# EasyEDA Pro project RUSH perseguidor - entalhe A.epro

# Board PCB1
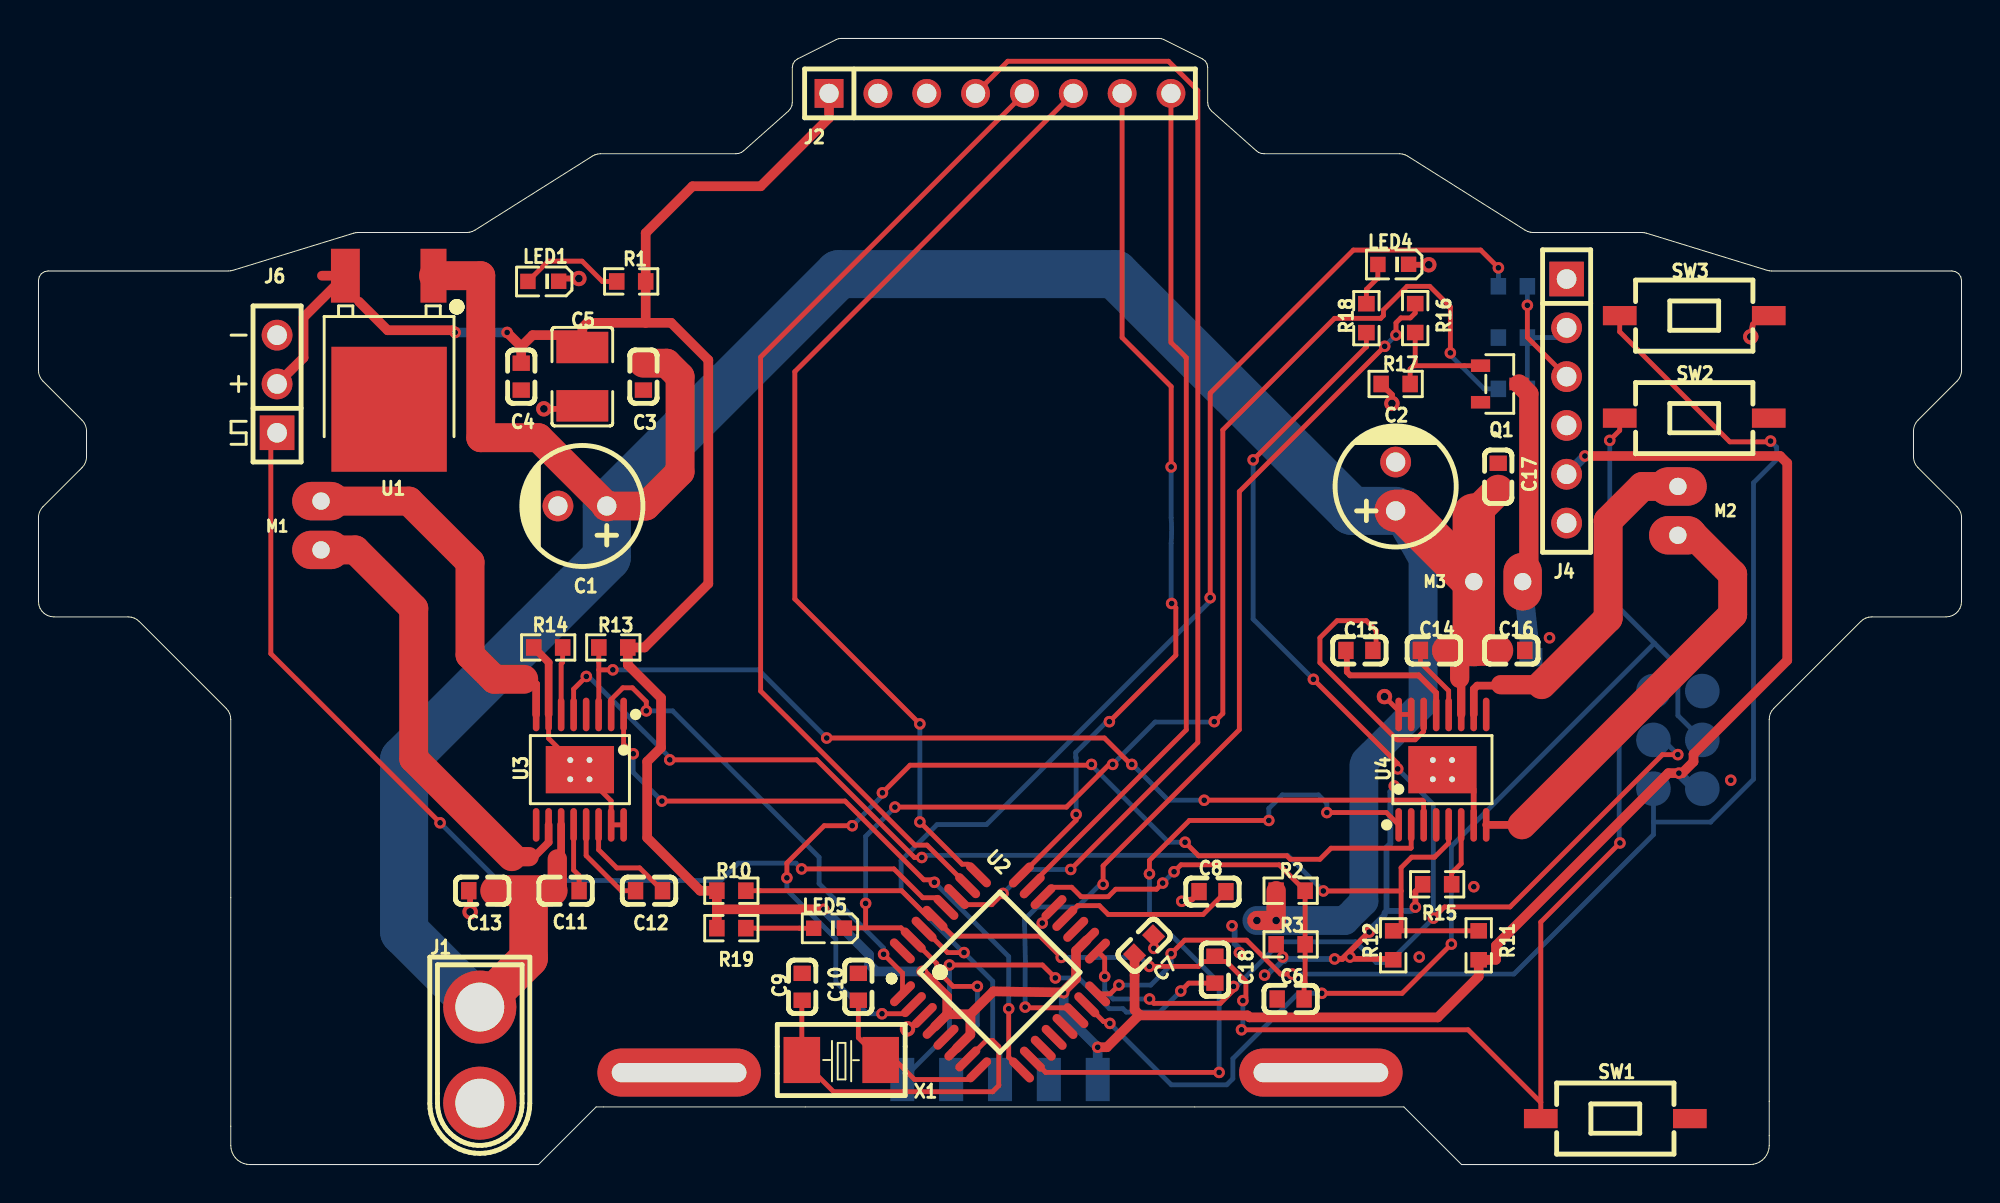
[diagram p0: board, top side]
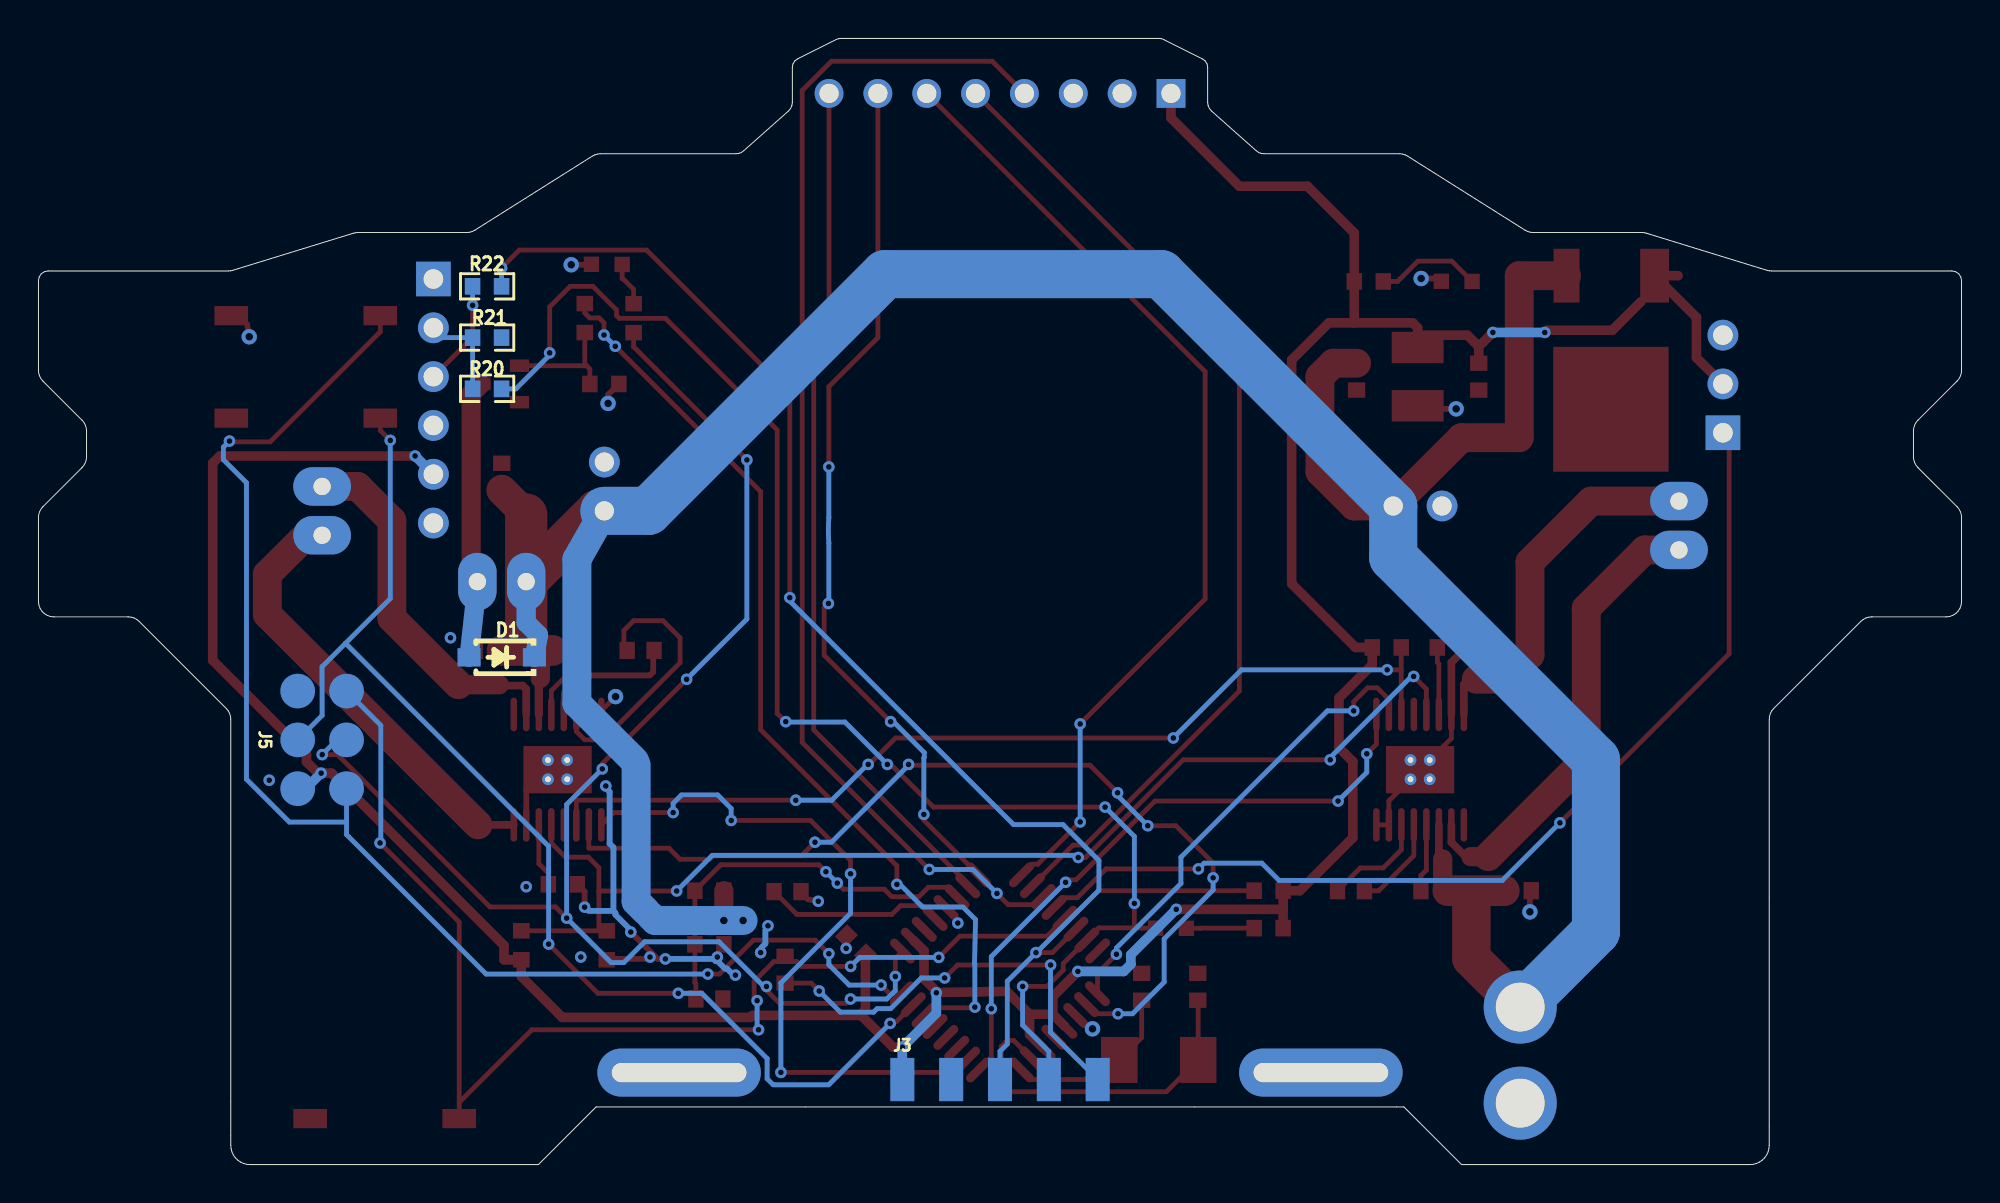
[diagram p1: board, bottom side, seen from below]

Outline 100 x 58.6 mm; copper layers: Top Layer, Bottom Layer. Coordinates in mm from the lower left corner of the outline.
Outline path: 0,46 0,41.33 arc(0.06,41.03) 0.23,40.77 2.27,38.73 arc(2.44,38.47) 2.5,38.17 2.5,36.83 arc(2.44,36.53) 2.27,36.27 0.23,34.23 arc(0.06,33.97) 0,33.67 0,29.3 0.02,29.12 0.08,28.95 0.17,28.8 0.3,28.67 0.45,28.58 0.62,28.52 0.8,28.5 4.67,28.5 4.83,28.48 4.97,28.44 5.11,28.36 5.23,28.27 9.77,23.73 9.86,23.61 9.94,23.47 9.98,23.33 10,23.17 10,1 10.02,0.83 10.06,0.66 10.13,0.5 10.23,0.36 10.36,0.23 10.5,0.13 10.66,0.06 10.83,0.01 11,0 26,0 29,3 71,3 74,0 89,0 89.17,0.01 89.34,0.06 89.5,0.13 89.64,0.23 89.77,0.36 89.87,0.5 89.94,0.66 89.99,0.83 90,1 90,23.17 90.01,23.33 90.06,23.47 90.13,23.61 90.23,23.73 94.77,28.27 94.89,28.36 95.03,28.44 95.18,28.48 95.33,28.5 99.2,28.5 99.38,28.52 99.55,28.58 99.7,28.67 99.82,28.8 99.92,28.95 99.98,29.12 100,29.3 100,33.67 arc(99.94,33.97) 99.77,34.23 97.73,36.27 arc(97.56,36.53) 97.5,36.83 97.5,38.17 arc(97.56,38.47) 97.73,38.73 99.77,40.77 arc(99.94,41.03) 100,41.33 100,46 99.96,46.19 99.85,46.35 99.69,46.46 99.5,46.5 90.12,46.5 90,46.51 89.88,46.53 83.62,48.47 83.5,48.49 83.38,48.5 77.73,48.5 77.58,48.51 77.44,48.56 77.3,48.62 71.2,52.48 71.06,52.54 70.92,52.59 70.77,52.6 63.73,52.6 63.58,52.62 63.45,52.67 63.33,52.75 61,54.82 60.89,54.95 60.82,55.1 60.8,55.27 60.8,57.09 60.77,57.27 60.67,57.43 60.52,57.54 58.51,58.55 58.4,58.59 58.28,58.6 41.72,58.6 41.6,58.59 41.49,58.55 39.48,57.54 39.33,57.43 39.23,57.27 39.2,57.09 39.2,55.27 39.18,55.1 39.11,54.95 39,54.82 36.67,52.75 36.55,52.67 36.42,52.62 36.27,52.6 29.23,52.6 29.08,52.59 28.94,52.54 28.8,52.48 22.7,48.62 22.56,48.56 22.42,48.51 22.27,48.5 16.62,48.5 16.5,48.49 16.39,48.47 10.11,46.53 10,46.51 9.88,46.5 0.5,46.5 0.31,46.46 0.15,46.35 0.04,46.19 0,46
Stack: Top Layer 0.035mm / Dielectric1 1.51mm FR4 er 4.5 / Bottom Layer 0.035mm

## Design rules (mm)
spacing copperThickness1oz (default): track to track 0.2, other pairs 0.2 to 0.3
spacing copperThickness2oz: track to track 0.203, other pairs 0.152 to 0.3
spacing Plane_innerPlane: track to track 0.2, other pairs 0.2 to 0.3
spacing Copper_copperRegion: track to track 0.2, other pairs 0.2 to 0.3
track width copperThickness1oz (default): min 0.25, default 0.25, max 3
track width copperThickness2oz: min 0.203, default 0.254, max 2.54
differential pair differentialPair (default): width min 0.127, default 0.254, max 2.54; gap min 0.152, default 0.152
net GND uses Copper_copperRegion, Plane_innerPlane
pour e1420 uses Copper_copperRegion
pour e1482 uses Copper_copperRegion

## Placement (name value [footprint] x y rotation side)
C1  220uF  [CAP-TH_BD6.3-P2.50-D1.0-FD]  28.28 34.27 180 top
C2  220uF  [CAP-TH_BD6.3-P2.50-D1.0-FD]  70.57 35.29 90 top
C3  220nF  [C0603]  31.46 41 270 top
C4  100nF  [C0603]  25.11 41 270 top
C5  47uF  [C1210]  28.28 41 90 top
C6  100nF  [C0603]  65.11 8.62 180 top
C7  100nF  [C0603]  57.49 11.41 45 top
C8  100nF  [C0603]  61.05 14.2 180 top
C9  22pF  [C0603]  39.71 9.25 90 top
C10  22pF  [C0603]  42.63 9.25 90 top
C11  100nF  [C0603]  27.41 14.25 0 top
C12  22nF  [C0603]  31.75 14.25 0 top
C13  100nF  [C0603]  23.08 14.25 180 top
C14  100nF  [C0603]  72.56 26.75 180 top
C15  22nF  [C0603]  68.69 26.75 0 top
C16  100nF  [C0603]  76.59 26.75 0 top
C17  100nF  [C0603]  75.91 35.79 90 top
C18  100nF  [C0603]  61.18 10.14 90 top
D1  1N5819  [SOD-123_L2.7-W1.6-LS3.7-RD-1]  75.91 26.4 0 bottom
J1  XT30 (bateria 2S)  [CONN-TH_XT30U-M]  22.95 5.69 270 top
J2  BARRA (1x8, 2,54 mm)  [HDR-TH_8P-P2.54-V-M]  50 55.74 0 top
J3  -  [seguidor_alpha:HDR_1x05_P2.54_SMD_DEITADA]  50 4.43 0 bottom
J4  -  [HDR-TH_6P-P2.54-V-F]  79.46 39.73 270 top
J5  -  [seguidor_alpha:ICSP_6P_SMD_BOT]  85.25 22.1 0 bottom
J6  -  [HDR-TH_3P-P2.54-V-F_KY022]  12.41 40.62 90 top
LED1  verde  [LED0603-RD_GREEN]  26.25 45.96 180 top
LED4  LED C  [LED0603-RD_GREEN]  70.45 46.84 180 top
LED5  TX  [LED0603-RD_GREEN]  41.11 12.3 180 top
M1  1020 esq.  [seguidor_alpha:MOTOR_1020_2P]  14.69 33.25 0 top
M2  1020 dir.  [seguidor_alpha:MOTOR_1020_2P]  85.25 34.02 180 top
M3  ventoinha  [seguidor_alpha:MOTOR_1020_2P]  75.91 30.33 270 top
NOREF  -  [Pad_e557]  66.69 4.79 270 top
NOREF#2  -  [Pad_e558]  33.31 4.79 270 top
Q1  AO3400A  [SOT-23-3_L2.9-W1.3-P1.90-LS2.4-BR]  75.99 40.62 180 top
R1  1k  [R0603]  30.82 45.95 180 top
R2  -  [R0603]  65.11 14.25 0 top
R3  -  [R0603]  65.11 11.46 180 top
R10  10k  [R0603]  36.03 14.25 0 top
R11  15k 1%  [R0603]  74.89 11.41 90 top
R12  10k 1%  [R0603]  70.45 11.41 270 top
R13  10k  [R0603]  29.89 26.91 180 top
R14  1.5k 1%  [R0603]  26.5 26.91 180 top
R15  1.5k 1%  [R0603]  72.73 14.58 180 top
R16  200  [R0603]  71.59 44.05 270 top
R17  10k  [R0603]  70.57 40.62 180 top
R18  1k  [R0603]  69.05 44.04 90 top
R19  1k  [R0603]  36.03 12.3 0 top
R20  1k  [R0603]  76.67 40.37 0 bottom
R21  2k  [R0603]  76.67 43.03 180 bottom
R22  4.7k  [R0603]  76.67 45.7 0 bottom
SW1  RESET  [KEY-SMD_L6.1-W3.7-LS8.0-2]  82 2.39 180 top
SW2  BOTÃO 1  [KEY-SMD_L6.1-W3.7-LS8.0-2]  86.1 38.84 0 top
SW3  BOTÃO 2  [KEY-SMD_L6.1-W3.7-LS8.0-2]  86.1 44.18 0 top
U1  78M05  [TO-252-2_L6.5-W6.1-P4.58-LS10.0-TL]  18.25 42.78 270 top
U2  ATmega328P-AU  [TQFP-32_L7.0-W7.0-P0.80-LS9.0-BL]  50 10 315 top
U3  DRV8874PWPR  [HTSSOP-16_L5.0-W4.4-P0.65-LS6.4-BL-EP]  28.15 20.55 180 top
U4  DRV8874PWPR  [HTSSOP-16_L5.0-W4.4-P0.65-LS6.4-BL-EP]  73.01 20.55 0 top
X1  16MHz  [CRYSTAL-SMD_L5.0-W3.2]  41.75 5.44 0 top

## Footprints (pads in the part's own frame, mm; a bottom-side part is the same pattern mirrored in y, then rotated)
C0603
  rect 0.8x0.9 smd: 1(-0.7,0) 2(0.7,0)
C1210
  rect 1.635x2.7 smd: 1(-1.518,0) 2(1.518,0)
CAP-TH_BD6.3-P2.50-D1.0-FD
  round 1.6 hole 1: 1(-1.27,0) 2(1.27,0)
CONN-TH_XT30U-M
  round 3.8 hole 2.54: 1(-2.5,0) 2(2.5,0)
CRYSTAL-SMD_L5.0-W3.2
  rect 1.9x2.4 smd: 1(-2.05,0) 2(2.05,0)
HDR-TH_3P-P2.54-V-F_KY022
  rect 1.8x1.8 hole 1.02: 1(-2.54,0)
  round 1.6 hole 1.02: 2(0,0) 3(2.54,0)
HDR-TH_6P-P2.54-V-F
  rect 1.8x1.8 hole 1.02: 1(-6.35,0)
  round 1.6 hole 1.02: 2(-3.81,0) 3(-1.27,0) 4(1.27,0) 5(3.81,0) 6(6.35,0)
HDR-TH_8P-P2.54-V-M
  rect 1.5x1.5 hole 1: 1(-8.89,0)
  round 1.5 hole 1: 2(-6.35,0) 3(-3.81,0) 4(-1.27,0) 5(1.27,0) 6(3.81,0) 7(6.35,0) 8(8.89,0)
HTSSOP-16_L5.0-W4.4-P0.65-LS6.4-BL-EP
  oval 0.343x1.746 smd: 1(-2.275,-2.873) 2(-1.625,-2.873) 3(-0.975,-2.873) 4(-0.325,-2.873) 5(0.325,-2.873) 6(0.975,-2.873) 7(1.625,-2.873) 8(2.275,-2.873) 9(2.275,2.873) 10(1.625,2.873) 11(0.975,2.873) 12(0.325,2.873) 13(-0.325,2.873) 14(-0.975,2.873) 15(-1.625,2.873) 16(-2.275,2.873)
  round 0.61 hole 0.305: 17(-0.5,0.5) 17(-0.5,-0.5) 17(0.5,0.5) 17(0.5,-0.5)
  rect 3.55x2.46 smd: 17(0,0)
KEY-SMD_L6.1-W3.7-LS8.0-2
  rect 1.75x1 smd: 1(-3.875,0) 2(3.875,0)
LED0603-RD_GREEN
  rect 0.8x0.8 smd: 1(-0.799,-0.004) 2(0.799,0.004)
Pad_e557
  oval 2.5x8.5 hole 1x7: 1(0,0)
Pad_e558
  oval 2.5x8.5 hole 1x7: 1(0,0)
R0603
  rect 0.806x0.864 smd: 1(-0.753,0) 2(0.753,0)
seguidor_alpha:HDR_1x05_P2.54_SMD_DEITADA
  rect 1.25x2.25 smd: 1(5.08,0) 2(2.54,0) 3(0,0) 4(-2.54,0) 5(-5.08,0)
seguidor_alpha:ICSP_6P_SMD_BOT
  round 1.8 smd: 1(-1.27,2.54) 2(1.27,2.54) 3(-1.27,0) 4(1.27,0) 5(-1.27,-2.54) 6(1.27,-2.54)
seguidor_alpha:MOTOR_1020_2P
  oval 3x2 hole 0.9: 1(0,-1.27) 2(0,1.27)
SOD-123_L2.7-W1.6-LS3.7-RD-1
  rect 1.2x0.95 smd: 1(-1.7,0) 2(1.7,0)
SOT-23-3_L2.9-W1.3-P1.90-LS2.4-BR
  rect 1x0.65 smd: 1(1,-0.95) 2(1,0.95) 3(-1,0)
TO-252-2_L6.5-W6.1-P4.58-LS10.0-TL
  rect 2.8x1.35 smd: 1(-3.475,2.29)
  rect 6.5x6 smd: 2(3.475,-0.017)
  rect 2.8x1.5 smd: 3(-3.475,-2.29)
TQFP-32_L7.0-W7.0-P0.80-LS9.0-BL
  oval 0.45x1.65 smd: 1(-2.8,-4.369) 2(-2,-4.369) 3(-1.2,-4.369) 4(-0.4,-4.369) 5(0.4,-4.369) 6(1.2,-4.369) 7(2,-4.369) 8(2.8,-4.369) 17(2.8,4.369) 18(2,4.369) 19(1.2,4.369) 20(0.4,4.369) 21(-0.4,4.369) 22(-1.2,4.369) 23(-2,4.369) 24(-2.8,4.369)
  oval 1.65x0.45 smd: 9(4.381,-2.8) 10(4.381,-2) 11(4.381,-1.2) 12(4.381,-0.4) 13(4.381,0.4) 14(4.381,1.2) 15(4.381,2) 16(4.381,2.8) 25(-4.381,2.8) 26(-4.381,2) 27(-4.381,1.2) 28(-4.381,0.4) 29(-4.381,-0.4) 30(-4.381,-1.2) 31(-4.381,-2) 32(-4.381,-2.8)

## Nets
+5V: C4.1 C5.2 C7.1 J2.1 J3.1 J4.5 J5.2 J6.2 R1.1 R10.1 R11.1 R13.1 R19.1 U1.3 U2.4 U2.6 U2.18
GND: C1.2 C2.2 C3.2 C4.2 C5.1 C6.2 C7.2 C8.2 C9.2 C10.2 C13.2 C16.2 C17.2 J1.2 J2.2 J3.2 J4.4 J5.6 J6.3 LED1.1 LED4.1 Q1.2 R3.2 R12.2 R14.2 R15.2 R17.2 R21.2 SW1.1 SW2.2 SW3.2 U1.2 U2.3 U2.5 U2.21 U3.7 U3.9 U3.15 U3.16 U3.17 U4.7 U4.9 U4.15 U4.16 U4.17
VBAT: C1.1 C2.1 C3.1 C11.1 C13.1 C14.1 C16.1 C17.1 D1.1 J1.1 M3.1 R2.1 U1.1 U3.11 U4.11
VBAT_A7: C6.1 R2.2 R3.1 U2.22
AREF: C8.1 U2.20
B1_D11: J5.4 SW2.1 U2.15
B2_D12: J5.1 SW3.1 U2.16
BT_RXD: J4.2 R20.2 R21.1
BT_TXD: J4.3 R22.2
C0_A4: J2.4 U2.27
CPH_A: C12.1 U3.13
CPH_B: C15.1 U4.13
CPL_A: C12.2 U3.14
CPL_B: C15.2 U4.14
DIRA_D3: U2.1 U3.2
DIRB_D4: U2.2 U4.2
DRV_SLEEP: R13.2 U3.3 U4.3
DTR: C18.1 J3.5
IPROPI_A: R14.1 U3.6
IPROPI_B: R15.1 U4.6
IR_A5: J6.1 U2.28
LEDA_D2: U2.32
LEDB_D7: U2.11
LEDC_D13: J5.3 R18.1 U2.17
MARK_R_A6: U2.19
OUT_A1: M1.2 U3.8
OUT_A2: M1.1 U3.10
OUT_B1: M2.2 U4.8
OUT_B2: M2.1 U4.10
OUT_C: D1.2 M3.2 Q1.3
PWMA_D5: U2.9 U3.1
PWMB_D6: U2.10 U4.1
PWMC_D10: R16.1 U2.14
RESET: C18.2 J5.5 R10.2 SW1.2 U2.29
RX_D0: J3.3 R22.1 U2.30
S0_A0: J2.8 U2.23
S1_A1: J2.7 U2.24
S2_A2: J2.6 U2.25
S3_A3: J2.5 U2.26
TX_D1: J3.4 LED5.1 R20.1 U2.31
VCP_A: C11.2 U3.12
VCP_B: C14.2 U4.12
VREF: R11.2 R12.1 U3.5 U4.5
XTAL1: C9.1 U2.7 X1.1
XTAL2: C10.1 U2.8 X1.2
$1N2070: LED1.2 R1.2
$1N2129: LED4.2 R18.2
$1N2130: LED5.2 R19.2
$1N2219: Q1.1 R16.2 R17.1

Pads without a net: J2 3; J4 1 6; NOREF 1; NOREF#2 1; U2 12 13; U3 4; U4 4

## Via types
v1: diameter 0.8, hole 0.4, Top Layer to Bottom Layer, 10 vias
v2: diameter 0.6, hole 0.3, Top Layer to Bottom Layer, 98 vias

## Routing (per net, layer and track width the routed paths; a pad name or vN(x,y) marks a point on that pad's centre or on a via; arc(x,y) is an arc through that point)
+5V: length 188.7
  Top Layer w0.5: 53.27,8.98 53.24,8.95 49.65,9.01 48.46,7.82 ; 53.27,8.98 v2(53.31,8.94) ; 53.27,8.98 53.95,9.67 53.95,11.12 U2.18 ; 47.25,7.82 47.25,8.74 45.95,10.04 v2(45.95,10.05) ; 47.25,7.82 48.46,7.82 ; 47.25,7.82 U2.4 ; 31.58,43.8 28.54,43.8 28.28,43.55 28.28,43.16 ; 31.58,43.8 32.9,43.8 34.83,41.87 34.83,30.23 31.51,26.91 R13.1 30.64,26.01 32.37,24.28 32.37,21.69 31.65,20.97 31.65,17 34.41,14.25 R10.1 35.28,13.28 ; 31.58,43.8 R1.1 31.58,48.47 34.01,50.91 37.55,50.91 41.11,54.46 J2.1 ; v2(21.67,43.3) 21.56,43.41 18.16,43.41 16.67,44.9 ; 14.74,46.25 U1.3 13.78,44.08 13.78,41.98 J6.2 ; 48.46,7.82 48.46,6.76 U2.6 ; C4.1 25.11,42.57 25.7,43.16 28.28,43.16 ; 28.28,43.16 28.28,42.52 ; v2(80.41,36.87) 90.57,36.87 90.94,36.5 90.94,26.24 86.06,21.36 86.06,20.96 85.47,20.37 v2(85.3,20.37) 84.75,20.37 75.79,11.4 75.79,10.66 R11.1 74.89,9.79 72.76,7.66 62.97,7.66 62.87,7.76 57.29,7.76 57.25,7.8 ; C7.1 57,8.05 57.25,7.8 ; 35.28,13.28 v2(40.84,13.28) ; 35.28,13.28 R19.1 ; v2(55.08,6.11) 55.56,6.11 57.25,7.8 ; v2(24.37,43.3) 24.97,42.7
  Bottom Layer w0.5: v2(21.67,43.3) v2(24.37,43.3) ; v2(85.3,20.37) 86.11,19.56 J5.2 ; J3.1 v2(55.08,6.11) 53.31,7.87 v2(53.31,8.94) ; v2(80.41,36.87) J4.5 ; v2(40.84,13.28) 43.2,10.92 43.2,10.42 43.57,10.05 v2(45.95,10.05)
GND: length 38.9
  Top Layer w0.25: v1(69.99,24.35) 70.73,23.61 U4.16 71.38,23.42 ; U3.7 26.53,22.17 U3.17 U3.17 U3.17 29.78,18.92 U3.15 U3.16
  Top Layer w0.3: 26.98,39.32 v1(26.28,39.32) ; 70.05,10.7 68.45,10.7 ; 74.63,18.45 74.63,19.52 ; v2(71.6,13.4) 71.6,14.21 R15.2 ; v2(67.4,10.7) 67.8,10.7 v2(69.2,12.1) ; v1(70.38,39.61) 70.38,40.06 R17.2 ; 27.4,46.11 v1(28.1,46.11) ; 71.6,46.82 v1(72.3,46.82) ; 89.15,43.73 v1(89.04,43.08) ; 22.45,13.85 v1(22.45,13.15) ; 60,13.8 v2(59.45,13.7)
  Top Layer w0.4: U3.7 26.53,26.13 R14.2
  Bottom Layer w0.3: 71.4,13.2 70.2,13.2 ; v2(67.4,10.7) 64.9,10.7 64.8,10.6 64.7,10.6 64.3,10.2 64.2,10.2 64,10 ; 62.4,11.3 62.2,11.5 62.2,12.2 ; 70.4,19.5 70.3,19.4 70.3,16.7 70.1,16.5 70.1,13.2 70,13.1 70,13 69.2,12.2 v2(69.2,12.1)
  vias: v1(45.19,7.06) v2(52.19,12.57) v2(58,11.25) v2(62.06,12.43) v2(62.45,11.03) v2(63.76,9.86) v2(64.7,10.8) v2(68.2,10.8) v2(70.5,19.7) v2(71.8,10.8) v2(74.64,14.46) v2(78.57,27.41) v2(88,20)
VBAT: length 184.7
  Top Layer w0.4: 73.98,25.3 73.9,25.3 ; C11.1 27.18,14.72 U3.11 ; 27.18,15.9 26.98,15.9
  Top Layer w0.43: U4.11 73.98,26.75
  Top Layer w1: R2.1 v1(64.36,12.7) v1(63.36,12.7) ; 73.9,25.3 73.9,26.75 ; 26.98,15.9 26.98,14.25
  Top Layer w1.5: 31.46,41.7 32.66,41.7 33.36,41 33.36,36.05 31.59,34.27 C1.1 26,37.82 23,37.82 23,46.25 U1.1
  Top Layer w1.6: C13.1 C11.1 ; C17.1 74.64,33.82 ; C14.1 C16.1
  Top Layer w2: 25.49,13.82 25.49,10.73 J1.1
  Top Layer w2.2: 74.64,33.82 M3.1 ; M3.1 74.64,27.03 ; M3.1 70.96,34.02 C2.1
  Bottom Layer w1: D1.1 74,27.56 74.64,28.2 M3.1
  Bottom Layer w1.5: v1(63.36,12.7) v1(64.36,12.7) 67.93,12.7 68.16,12.93 ; 68.41,13.19 68.92,13.7 68.92,20.81 ; 69,21 72,24 72,31.5 C2.1
  Bottom Layer w2.5: J1.1 19.01,12.13 19.01,21.06 29.55,31.6 C1.1 41.62,46.33 55.97,46.33 68.29,34.02 C2.1
VBAT_A7: length 20.9
  Top Layer w0.25: v2(59.05,15.24) 59.41,15.6 64.52,15.6 R2.2 R3.1 65.87,9.46 65.81,9.41 C6.1 ; v2(58.46,14.65) 58.14,14.33 56.02,14.33 55.63,13.94 54.22,13.94 53.73,14.43 52.73,14.43 U2.22
  Bottom Layer w0.25: v2(59.05,15.24) v2(58.46,14.65)
AREF: length 9.3
  Top Layer w0.25: U2.20 54.04,13.47 55.17,13.47 55.62,13.02 60.56,13.02 C8.1
B1_D11: length 63.3
  Top Layer w0.25: SW2.1 82.22,38.2 v2(81.71,37.68) ; 55.61,7.45 55.38,7.45 U2.15 ; v2(55.71,7.35) 55.61,7.45 ; v2(73.47,11.47) 70.91,8.91 v2(66.73,8.91)
  Bottom Layer w0.25: v2(81.71,37.68) 81.71,29.45 84.03,27.13 ; v2(66.73,8.91) 65.51,8.91 62.11,5.52 62.11,4.47 61.79,4.15 58.91,4.15 v2(55.71,7.35) ; 84.03,27.13 73.47,16.56 v2(73.47,11.47) ; 84.03,27.13 85.25,25.91 85.25,23.37 J5.4
B2_D12: length 71.9
  Top Layer w0.25: v2(58.9,10.97) 59.6,11.68 62.82,11.68 64.59,9.91 v2(65.2,9.91) ; SW3.1 82.22,43.33 87.95,37.61 90.03,37.61 v2(90.07,37.65) ; U2.16 55.73,8.88 v2(56.19,9.34)
  Bottom Layer w0.25: v2(90.07,37.65) 90.39,37.33 90.39,36.68 89.18,35.48 89.18,20.05 86.95,17.82 83.98,17.82 ; 83.98,17.82 J5.1 ; 83.98,17.82 83.98,17.17 76.72,9.91 v2(65.2,9.91) ; v2(58.9,10.97) 58.9,10.4 57.84,9.34 v2(56.19,9.34)
BT_RXD: length 4.9
  Bottom Layer w0.25: R20.2 R21.1 78.96,43.03 J4.2
BT_TXD: length 5.5
  Top Layer w0.25: v2(77.42,44.72) 77.42,43.04 J4.3
  Bottom Layer w0.25: v2(77.42,44.72) R22.2
C0_A4: length 63
  Top Layer w0.25: J2.4 50.4,57.41 58.76,57.41 60.29,55.89 60.29,21.97 v2(53.68,15.36) ; v2(50.16,14.11) 49.57,13.52 48.17,13.52 47.75,13.95
  Bottom Layer w0.25: v2(53.68,15.36) 51.41,15.36 v2(50.16,14.11)
CPH_A: length 4.9
  Top Layer w0.25: C12.1 30.31,14.25 28.48,16.08 28.48,17.68
CPH_B: length 7.4
  Top Layer w0.3: C15.1 68.03,26.71 68.03,25.63 68.21,25.46 71.77,25.46 72.68,24.54 U4.13
CPL_A: length 5.5
  Top Layer w0.25: C12.2 31.26,15.44 30.07,15.44 29.13,16.38 U3.14
CPL_B: length 14.1
  Top Layer w0.25: C15.2 69.51,26.75 69.56,26.8 69.56,27.79 69.05,28.3 67.53,28.3 66.64,27.41 66.64,26.11 70.65,22.11 71.59,22.11 72.03,22.54 U4.14
DIRA_D3: length 24.7
  Top Layer w0.25: U3.2 29.78,24.2 30.39,24.81 30.89,24.81 31.61,24.09 v2(31.61,23.61) ; v2(43.95,10.94) 44.93,9.96 44.93,8.89
  Bottom Layer w0.25: v2(31.61,23.61) 32.98,23.61 40.59,15.99 40.59,14.62 43.95,11.27 v2(43.95,10.94)
DIRB_D4: length 50.3
  Top Layer w0.25: v2(38.92,14.92) 38.92,15.69 40.85,17.63 v2(42.32,17.63) ; U2.2 45.02,7.85 v2(43.86,7.85) ; v2(59.62,16.77) 60.33,16.07 64.92,16.07 65.1,15.89 66.64,15.89 67.21,16.46 71.37,16.46 71.38,16.48 71.38,17.68 ; v2(43.89,19.34) 45.32,20.78 54.75,20.78
  Bottom Layer w0.25: v2(43.89,19.34) 43.89,19.2 v2(42.32,17.63) ; 54.75,20.78 58.76,16.77 v2(59.62,16.77) ; v2(43.86,7.85) 43.11,7.85 41.46,9.5 41.46,11.75 38.92,14.29 v2(38.92,14.92)
  vias: v2(54.75,20.82)
DRV_SLEEP: length 50.4
  Top Layer w0.25: 56.85,20.86 56.77,20.86 55.43,22.2 v2(40.99,22.2) ; v2(60.62,18.96) 60.62,18.96 71.96,18.96 72.03,18.89 U4.3 ; 29.14,25.74 R13.2 ; 29.14,25.74 v2(29.87,25.74) ; 29.14,25.74 29.14,23.43 U3.3
  Bottom Layer w0.25: 56.85,20.86 58.75,18.96 v2(60.62,18.96) ; v2(40.99,22.2) 37.44,25.74 v2(29.87,25.74)
  vias: v2(56.85,20.82)
DTR: length 22.4
  Top Layer w0.25: v2(47.37,10.39) 52.21,10.39 v2(52.88,9.71) ; v2(59.4,9.03) 59.81,9.44 C18.1
  Bottom Layer w0.25: v2(59.4,9.03) 58.3,7.93 56.57,7.93 56.39,8.11 55.69,8.11 54.09,9.71 v2(52.88,9.71) ; v2(47.37,10.39) 47.37,6.88 J3.5
IPROPI_A: length 3.5
  Top Layer w0.25: R14.1 27.26,26.13 27.18,26.06 U3.6
IPROPI_B: length 3.3
  Top Layer w0.25: R15.1 73.49,15.17 73.98,15.66 73.98,17.68
IR_A5: length 53
  Top Layer w0.25: v2(39.68,15.38) 44.48,15.38 45.98,13.88 46.68,13.88 47.18,13.38 ; J6.1 12.08,37.78 12.08,26.58 v2(20.88,17.78)
  Bottom Layer w0.25: v2(39.68,15.38) 39.38,15.68 36.38,15.68 35.48,14.78 23.88,14.78 v2(20.88,17.78)
LEDC_D13: length 77
  Top Layer w0.25: v2(57.78,8.61) 58,8.39 61.46,8.39 62.14,9.07 v2(62.14,9.27) ; v2(85.25,21.33) 84.45,21.33 76.52,13.41 73.12,13.41 v2(72.53,12.83) ; v2(66.3,25.25) 70.68,20.87 v2(70.68,20.59) ; 69.05,43.29 69.05,42.55 69.04,42.55 v2(63.16,36.67) ; v2(55.44,9.79) 55.44,10.73 55.07,11.11
  Bottom Layer w0.25: v2(85.25,21.33) 84.48,22.1 J5.3 ; v2(55.44,9.79) 55.44,9.06 55.88,8.61 v2(57.78,8.61) ; v2(63.16,36.67) 63.16,28.39 v2(66.3,25.25) ; v2(62.14,9.27) 62.28,9.27 64.61,11.59 68.48,11.59 69.56,10.51 70.22,10.51 v2(72.53,12.83) 72.53,18.74 v2(70.68,20.59)
OUT_A1: length 19.1
  Top Layer w0.4: 25.88,23.42 25.88,24.99 25.62,25.25
  Top Layer w1.5: M1.2 19.27,34.52 22.44,31.35 22.44,26.52 23.71,25.25 25.23,25.25
OUT_A2: length 23.9
  Top Layer w0.4: 25.87,16.11 26.53,16.77 U3.10
  Top Layer w1: 25.51,16.02 24.61,16.02
  Top Layer w1.5: 19.52,28.94 16.47,31.98 M1.1 ; 19.51,28.94 19.51,21.12 24.61,16.02
OUT_B1: length 23.1
  Top Layer w0.4: 77.14,17.68 U4.8
  Top Layer w1.5: 77.14,17.68 88.1,28.63 88.1,30.71 86.07,32.75 M2.2
OUT_B2: length 19.2
  Top Layer w0.4: 74.64,23.43 74.64,24.75 74.81,24.92 75.99,24.92
  Top Layer w1: 78.16,24.97 76.03,24.97
  Top Layer w1.5: 78.16,24.97 81.62,28.43 81.62,33.51 83.4,35.29 M2.1
OUT_C: length 14.6
  Top Layer w1: Q1.3 77.5,40.11 77.5,30.66 M3.2
  Bottom Layer w1: M3.2 D1.2
PWMA_D5: length 32.9
  Top Layer w0.25: v2(30.93,21.38) 30.43,21.88 U3.1 ; v2(46.59,14.69) 46.46,14.82 46.04,14.82 41.94,18.92 v2(32.42,18.92) ; v2(50.45,8.11) 50.45,5.59 U2.9
  Bottom Layer w0.25: v2(50.45,8.11) 50.45,10.82 v2(46.59,14.69) ; v2(32.42,18.92) 30.93,20.41 v2(30.93,21.38)
PWMB_D6: length 38.2
  Top Layer w0.25: v2(63.98,17.91) 59.85,17.91 57.77,15.83 v2(57.77,15.13) ; U2.10 52.38,4.79 v2(61.39,4.79) ; v2(67,18.32) 70.09,18.32 U4.1
  Bottom Layer w0.25: v2(61.39,4.79) 61.39,9.45 57.77,13.07 v2(57.77,15.13) ; v2(67,18.32) 67,18.8 66.56,19.23 64.68,19.23 63.98,18.53 v2(63.98,17.91)
PWMC_D10: length 49.3
  Top Layer w0.25: v2(55.36,14.58) 55.36,15.55 62.44,22.63 62.44,35.02 v2(70,42.58) ; U2.14 53.54,8.16 51.34,8.16 v2(51.31,8.19) ; v2(70.59,43.17) 70.59,43.8 70.84,44.06 71.34,44.06 71.59,44.31 R16.1
  Bottom Layer w0.25: 51.32,10.54 51.32,10.45 ; 51.32,10.45 51.31,10.43 v2(51.31,8.19) ; 51.32,10.45 51.27,12.75 51.93,13.4 54.03,13.4 55.12,14.5 ; v2(70.59,43.17) v2(70,42.58)
RESET: length 72.9
  Top Layer w0.25: v2(62.56,7.01) 74.34,7.01 78.12,3.24 ; R10.2 44.88,14.25 46.32,12.81 46.62,12.81 47.55,11.89 52.08,11.89 v2(53.19,10.78) ; SW1.2 78.12,3.24 ; 78.12,3.24 78.12,12.62 v2(82.24,16.74) ; 61.18,10.56 60.59,10.56 60.33,10.31 v2(57.77,10.31) ; 61.18,10.56 C18.2 ; 61.18,10.56 61.76,10.56 62.79,9.54 62.79,8.69 v2(62.63,8.53)
  Bottom Layer w0.25: v2(53.19,10.78) 57.3,10.78 v2(57.77,10.31) ; J5.5 82.2,22.86 82.2,16.78 v2(82.24,16.74) ; v2(62.56,7.01) 62.63,7.08 v2(62.63,8.53)
RX_D0: length 68
  Top Layer w0.25: v2(75.92,46.67) 74.99,47.59 68.38,47.59 60.93,40.14 v2(60.93,29.5) ; v2(48.13,11.03) 47.27,11.03 46.05,12.25
  Bottom Layer w0.25: v2(60.93,29.5) 60.93,29.33 49.3,17.69 46.73,17.69 44.86,15.82 44.86,14.28 48.1,11.03 v2(48.13,11.03) 49.62,9.54 49.62,6.27 50,5.89 J3.3 ; R22.1 v2(75.92,46.67)
S0_A0: length 44.9
  Top Layer w0.25: J2.8 58.89,42.78 59.69,41.98 59.69,22.62 51.68,14.61 U2.23
S1_A1: length 45.3
  Top Layer w0.25: v2(55.69,23.05) 59.14,26.5 59.14,28.98 v2(58.93,29.2) ; J2.7 56.35,43.03 58.9,40.48 v2(58.9,36.3) ; v2(53.96,18.22) 53.96,17.92 51.11,15.07
  Bottom Layer w0.25: v2(58.93,29.2) 58.9,29.22 58.9,32.33 arc(58.92,33) 58.9,33.67 v2(58.9,36.3) ; v2(53.96,18.22) 53.96,21.17 53.94,21.19 53.94,21.44 55.54,23.05 v2(55.69,23.05)
S2_A2: length 50.8
  Top Layer w0.25: J2.6 39.33,41.26 39.33,29.43 v2(45.83,22.93) ; v2(45.83,17.83) 48.03,15.63 48.33,15.63 U2.25
  Bottom Layer w0.25: v2(45.83,22.93) v2(45.83,17.83)
S3_A3: length 51.7
  Top Layer w0.25: U2.26 46.21,16.62 45.57,16.62 37.55,24.64 37.55,42.02 J2.5
TX_D1: length 75.8
  Top Layer w0.25: 43.01,12.32 v2(43.01,13.59) ; 43.01,12.32 42.67,12.32 42.65,12.3 41.91,12.3 ; 43.01,12.32 44.85,12.32 U2.31 46.71,10.46 46.71,10.12 47.56,9.27 v2(48.82,9.27) ; 61.14,23.03 61.59,23.47 61.59,38.23 67.4,44.04 69.8,44.04 69.94,44.18 69.94,44.47 71.17,45.7 72.35,45.7 73.42,44.63 v2(73.42,42.24) ; v2(55.86,20.82) 55.68,20.82 53.46,18.6 44.54,18.6
  Bottom Layer w0.25: v2(44.54,18.6) 43.01,17.08 v2(43.01,13.59) ; J3.4 47.46,5.89 48.82,7.25 v2(48.82,9.27) ; v2(73.42,42.24) 73.42,42.12 75.17,40.37 R20.1 ; v2(55.86,20.82) 58.06,23.03 61.14,23.03
  vias: v2(61.14,23.05)
VCP_A: length 3.5
  Top Layer w0.25: U3.12 27.83,15.33 28.11,15.04 C11.2
VCP_B: length 3.9
  Top Layer w0.25: U4.12 73.33,24.66 71.86,26.12 71.86,26.75
VREF: length 61.1
  Top Layer w0.25: 70.86,12.16 R11.2 ; 70.86,12.16 70.86,14.24 ; 70.86,12.16 R12.1 ; v2(28.49,25.4) 27.83,24.74 U3.5 ; 70.86,14.24 70.86,15.45 71.41,16 72.6,16 73.33,16.73 U4.5 ; 70.86,14.24 v2(66.81,14.24) ; v2(45.93,15.98) 45.55,15.98 40.47,21.06 v2(32.83,21.06)
  Bottom Layer w0.25: v2(66.81,14.24) 64.96,16.09 46.04,16.09 v2(45.93,15.98) ; v2(28.49,25.4) 28.61,25.4 32.83,21.18 v2(32.83,21.06)
XTAL1: length 18.4
  Top Layer w0.25: U2.7 49.29,6.46 49.62,6.46 49.94,6.14 49.94,4.11 49.62,3.79 41.35,3.79 X1.1 39.69,8.54 C9.1
XTAL2: length 9.3
  Top Layer w0.25: C10.1 42.63,6.6 X1.2 44.54,5.44 45.56,4.43 48.38,4.43 48.89,4.93
$1N2070: length 5.5
  Top Layer w0.25: LED1.2 26.51,47.01 28.27,47.01 29.32,45.95 R1.2
$1N2129: length 2.3
  Top Layer w0.25: LED4.2 69.65,46.1 69.61,46.1 69.05,45.54 69.05,44.8
$1N2130: length 3.5
  Top Layer w0.25: 40.31,12.3 39.57,12.3 39.56,12.3 R19.2
$1N2219: length 6.2
  Top Layer w0.25: 71.59,41.57 R16.2 ; 71.59,41.57 Q1.1 ; 71.59,41.57 71.5,41.57 71.33,41.39 R17.1

## Copper pours and planes (outline as drawn; the poured copper is in the pictures)
GND on Top Layer: -30.77,71.1 130.77,71.1 130.77,-11.58 -30.77,-11.58
GND on Bottom Layer: -27.09,63.86 125.69,63.86 125.69,-5.35 -27.09,-5.35
